# Altium project mc.PrjPCB
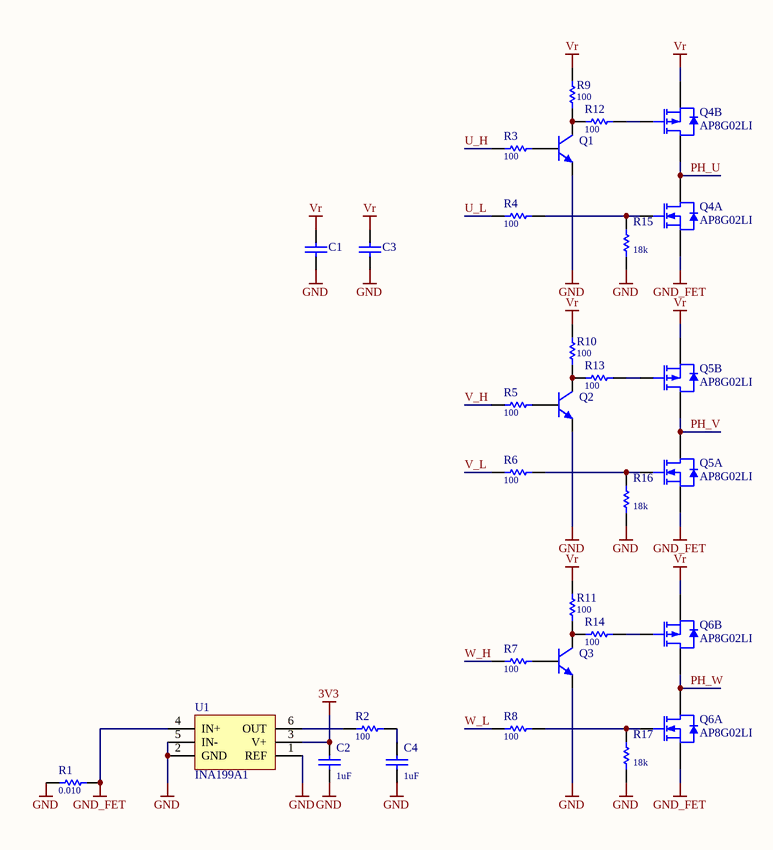
[diagram p0: board.SchDoc]
PRJ_ID: 05-03; PRJ_VER: v2.1.1
1 sheet, 28 parts. Net scope: global (net labels, ports and power ports of the same name join across sheets).
Board file: board.PcbDoc

## Sheet board.SchDoc: Display & buttons board
size A3; Revision: 1; SheetNumber: 6; SheetTotal: 29

### Parts
C1  4n7  [C1210-2.5MM]  (value not drawn)
C2  1uF  [C0603]
C3  4n7  [C1210-2.5MM]  (value not drawn)
C4  1uF  [C0603]
Q1  MMBT2222  [SOT-23]  (value not drawn)
Q2  MMBT2222  [SOT-23]  (value not drawn)
Q3  MMBT2222  [SOT-23]  (value not drawn)
Q4  AP8G02LI  [SOT-23-6]  (parts A,B of 2)
Q5  AP8G02LI  [SOT-23-6]  (parts A,B of 2)
Q6  AP8G02LI  [SOT-23-6]  (parts A,B of 2)
R1  0.010  [R1206]
R2  100  [R0603]
R3  100  [R0603]
R4  100  [R0603]
R5  100  [R0603]
R6  100  [R0603]
R7  100  [R0603]
R8  100  [R0603]
R9  100  [R0603]
R10  100  [R0603]
R11  100  [R0603]
R12  100  [R0603]
R13  100  [R0603]
R14  100  [R0603]
R15  18k  [R0603]
R16  18k  [R0603]
R17  18k  [R0603]
U1  INA199A1  [SC-70-6]

### Nets
3V3: C2.2 U1.3(V+)
GND: C1.2 C2.1 C3.2 C4.1 Q1.2(E) Q2.2(E) Q3.2(E) R1.1 R15.2 R16.2 R17.2 U1.1(REF) U1.2(GND) U1.5(IN-)
GND_FET: Q4.5(S1) Q5.5(S1) Q6.5(S1) R1.2 U1.4(IN+)
Vr: C1.1 C3.1 Q4.2(S2) Q5.2(S2) Q6.2(S2) R9.2 R10.2 R11.2
PH_U: Q4.4(D2) Q4.6(D1)
PH_V: Q5.4(D2) Q5.6(D1)
PH_W: Q6.4(D2) Q6.6(D1)
U_H: R3.1
U_L: R4.1
V_H: R5.1
V_L: R6.1
W_H: R7.1
W_L: R8.1
NetC4_2: C4.2 R2.2
NetQ1_1: Q1.1(B) R3.2
NetQ1_3: Q1.3(C) R9.1 R12.1
NetQ2_1: Q2.1(B) R5.2
NetQ2_3: Q2.3(C) R10.1 R13.1
NetQ3_1: Q3.1(B) R7.2
NetQ3_3: Q3.3(C) R11.1 R14.1
NetQ4_1: Q4.1(G1) R4.2 R15.1
NetQ4_3: Q4.3(G2) R12.2
NetQ5_1: Q5.1(G1) R6.2 R16.1
NetQ5_3: Q5.3(G2) R13.2
NetQ6_1: Q6.1(G1) R8.2 R17.1
NetQ6_3: Q6.3(G2) R14.2
NetR2_1: R2.1 U1.6(OUT)

### Library data of the parts
C1 C3 = CAP: 4n7 0402
C2 C4 = CAP: 1uF 0603
Q1-Q3 = MMBT2222ALT1G: LCSC part number: C82460; P/N: MMBT2222ALT1G
Q4-Q6 = AP8G02LI: MOSFET N-CH & P-CH; P/N: IRLML2502TRPBF; LCSC part number: C2589
R1-R14 = RES: P/N: RC0402FR-0718KL; LCSC part number: C138044
R15-R17 = RES: 18k 0402; P/N: RC0402FR-0718KL; LCSC part number: C138044